# Altium project LUCID_LIGHT_PCB_Outer.PrjPcb
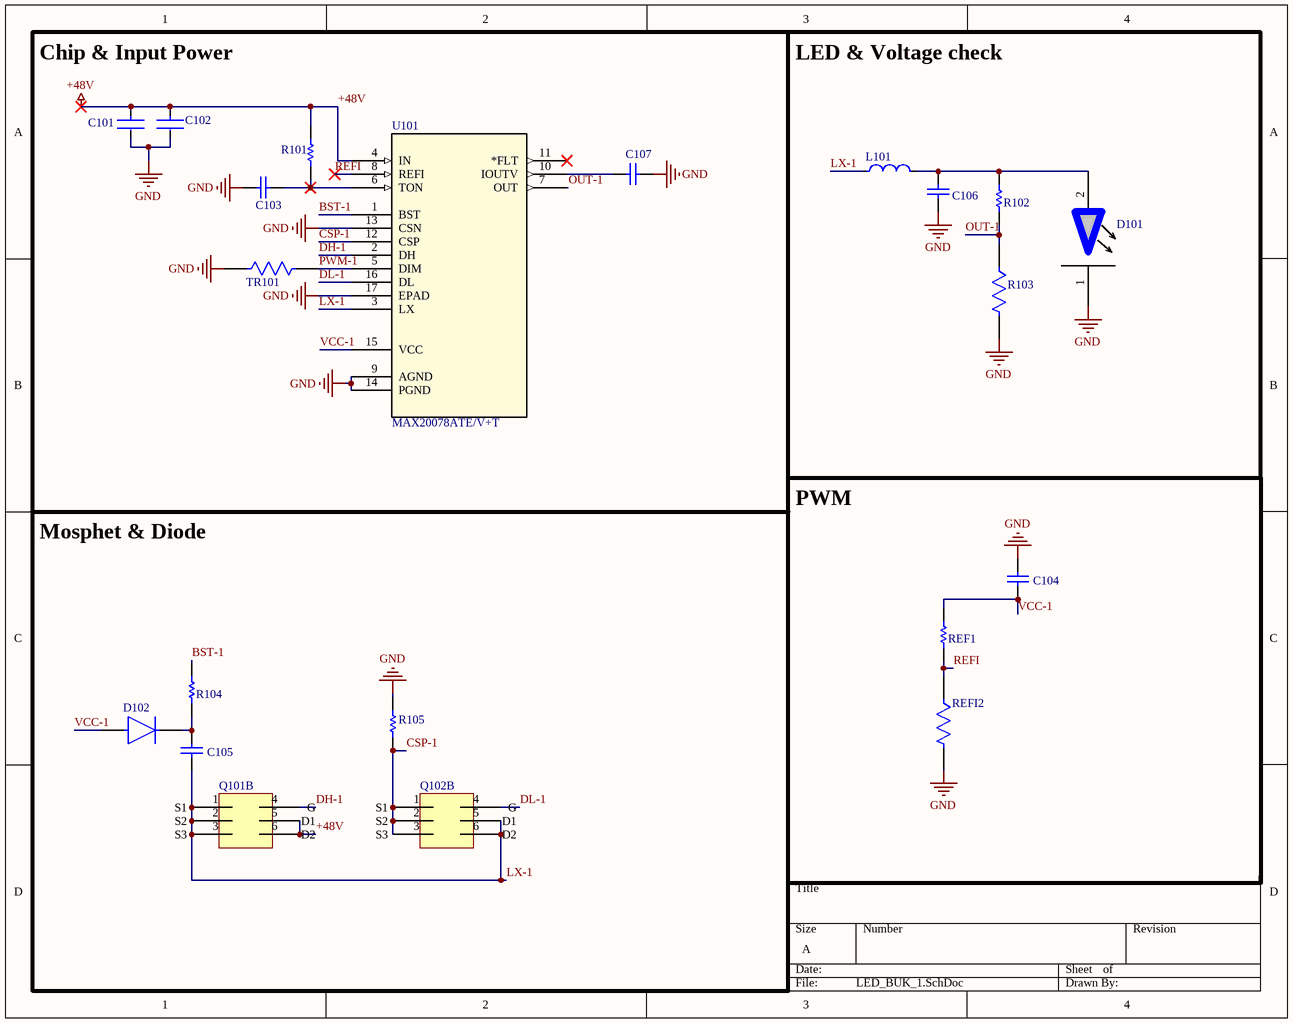
[diagram p0: LED_BUK_1.SchDoc]
7 sheets, 120 parts. Net scope: global (net labels, ports and power ports of the same name join across sheets).
Board file: LUCID_LIGHT_PCB_Outer.PcbDoc
Sheets:
  LED_BUK_1.SchDoc
  Power_Connector.SchDoc
  LED_BUK_2.SchDoc
  LED_BUK_3.SchDoc
  LED_BUK_4.SchDoc
  LED_BUK_5.SchDoc
  LED_BUK_6.SchDoc

## Sheet LED_BUK_1.SchDoc
size A; SheetNumber: 1; SheetTotal: 7

### Parts
C101  12101C225KAT2A  [FP-1210-L_3_3_0_4-W_2_5_0-IPC_B]  (value not drawn)
C102  12101C225KAT2A  [FP-1210-L_3_3_0_4-W_2_5_0-IPC_B]  (value not drawn)
C103  GRM1885C1H471JA01D  [C_0603_1608Metric]  (value not drawn)
C104  *AC0805KFX7R7BB225  [C_0805_2012Metric]  (value not drawn)
C105  CL10B224KA8NNNC  [C_0603_1608Metric]  (value not drawn)
C106  CL31B105KCHVPNE  [C_1210_3225Metric]  (value not drawn)
C107  CL31B105KCHVPNE  [C_1210_3225Metric]  (value not drawn)
D101  On back of PCB  [Bridgelux_V22_Custom]  (value not drawn)
D102  B180-13-F  [D_SMA_DO-214AC]  (value not drawn)
L101  YSPI1365-470M  [L_YSPI1365_470M]  (value not drawn)
Q101  custom mosfet  [LFPAK56_SOT669_BUK9Y107]  (value not drawn)  (part B of 2)
Q102  custom mosfet  [LFPAK56_SOT669_BUK9Y107]  (value not drawn)  (part B of 2)
R101  *RC0603FR-0747K5L  [R_0603_1608Metric]  (value not drawn)
R102  RC0603FR-07324KL  [RESC1608X55X25NL10T15]  (value not drawn)
R103  RC0603FR-0724K9L  [FP-RC_L0603-MFG]  (value not drawn)
R104  4R7 1% 0603(1608)  [RESC0603(1608)_M]  (value not drawn)
R105  FRM121WFR100TM  [R_1206_3216Metric]  (value not drawn)
REF1  ERJ-3EKF3162V  [RESC1608X55X30NL15T15]  (value not drawn)
REFI2  RC0603FR-0710KL  [FP-RC0603-0_55-IPC_C]  (value not drawn)
TR101  RC0603FR-0710KL  [FP-RC0603-0_55-IPC_C]  (value not drawn)
U101  MAX20078ATE/V+T  [21-0136V_T1633+4C_MXM]

### Nets
+48V: C101.1 C102.1 Q101.5(D1) Q101.6(D2) R101.1 U101.4(IN)
GND: C101.2 C102.2 C103.1 C104.1 C106.2 C107.2 D101.1 R103.2 R105.1 REFI2.2 TR101.1 U101.9(AGND) U101.13(CSN) U101.14(PGND) U101.17(EPAD)
BST-1: R104.2 U101.1(BST)
CSP-1: Q102.1(S1) Q102.2(S2) Q102.3(S3) R105.2 U101.12(CSP)
DH-1: Q101.4(G) U101.2(DH)
DL-1: Q102.4(G) U101.16(DL)
LX-1: C105.2 L101.1 Q101.1(S1) Q101.2(S2) Q101.3(S3) Q102.5(D1) Q102.6(D2) U101.3(LX)
OUT-1: R102.2 R103.1 U101.7(OUT)
PWM-1: TR101.2 U101.5(DIM)
REFI: REF1.2 REFI2.1 U101.8(REFI)
VCC-1: C104.2 D102.2(A) REF1.1 U101.15(VCC)
NetC103_2: C103.2 R101.2 U101.6(TON)
NetC105_1: C105.1 D102.1(C) R104.1
NetC106_1: C106.1 D101.2 L101.2 R102.1
NetC107_1: C107.1 U101.10(IOUTV)

Not connected (* = marked no-connect by the designer): U101 11(*FLT)*

### Notes on the sheet
- Chip & Input Power
- LED & Voltage check
- PWM
- Mosphet & Diode

### Library data of the parts
C101 C102 = CMP-1038-02104-3: General Purpose Ceramic Capacitor, 1210, 2.2uF, 10%, X7R, 15%, 100V; Dissipation Factor: 2.5%; Number of Pins: 2; Lead Free: Lead Free; Voltage Rating: 100V; Min Operating Temperature: -55°C; Height: 2.79mm; Length: 3.2mm; Capacitance: 2.2uF; RoHS Compliant: Yes; Case/Package: 1210; Max Operating Temperature: 125°C; Radiation Hardening: No; Series: -; Case Code (Metric): 3225; Dielectric: X7R; Voltage Rating (DC): 100V; Packaging: Tape and Reel; Width: 2.5mm; Thickness: 0.11inch; Depth: 2.5mm; Contact Plating: Tin; REACH SVHC: No SVHC; Tolerance: 10%; Construction: Flat; Case Code (Imperial): 1210; Mount: Surface Mount; Package Quantity: 1; Termination: SMD/SMT; Voltage: 100V; LCSC Part #: C2168116
C103 = GRM1885C1H471JA01D: 470 pF, 50 V, C0G, 0603; LCSC Part #: C85979; Supplier 1: Avnet; Supplier Part Number 1: GRM1885C1H471JA01D
C104 = AC0805KFX7R7BB225: 2.2 µF, 16 V, X7R, 0805; Supplier 1: Avnet; Supplier Part Number 1: AC0805KFX7R7BB225; LCSC Part #: C20143097
C105 = CL10B224KA8NNNC: 0.22 µF, 25 V, X7R, 0603; Supplier 1: Future Electronics; Supplier Part Number 1: CL10B224KA8NNNC; LCSC Part #: C21120
C106 C107 = CL31B105KCHVPNE: 1 µF, 100 V DC, 1206 (3216 metric); Supplier 1: Mouser; Supplier Part Number 1: 187-CL31B105KCHVPNE; LCSC Part #: C307368
D101 = Bridgelux_V22_Custom
D102 = B180-13-F: Schottky diode, SMA; Supplier 1: Newark; Supplier Part Number 1: B180-13-F; LCSC Part #: C155354
L101 = CompoYSPI1365-470Mnent_1: 47 µH inductor; LCSC Part #: C497913
Q101 Q102 = BUK9Y107-80EX: 80 V N-channel MOSFET; LSCS Part #: C503620; Supplier 1: Arrow Electronics; Supplier Part Number 1: BUK9Y107-80EX
R101 = RC0603FR-0747K5L: 47.5 kΩ; Supplier 1: Newark; Supplier Part Number 1: RC0603FR-0747K5L; LCSC Part #: C137715
R102 = CMP-2000-04009-1: Manufacturer: Yageo; Part Number: RC0603FR-07324KL; LCSC Part #: C273758
R103 = CMP-03412-013083-1: RES SMD 24.9K OHM 1% 1/10W 0603; Manufacturer: Yageo; Approved Alternate Part Number: 541-1.00HHCT-ND; Voltage Rating: 75V; Power Rating: 0.1W; Resistance: 24.9kΩ; Value: 24.9kΩ; Power: 100mW; Temperature Coefficient: 100ppm/°C; Footprint Url: https://www.yageo.com/upload/website/yageo_PYu-R_Mount_10_19050818_343.pdf; Automotive: No; Temperature Range Low: -55°C; Manufacturer Part Number: RC0603FR-0724K9L; Ipc Land Pattern Name: RESC16080X45; Digikey Description: RES SMD 24.9K OHM 1% 1/10W 0603; Voltage: 75V; Composition: Thick Film; Device Class L1: Passive Components; Device Class L2: Resistors; Device Class L3: Chip SMD Resistors; ComponentLink2URL: https://www.yageo.com/upload/media/product/productsearch/datasheet/rchip/PYu-RC_Group_51_RoHS_L_10.pdf; Series: RC_L; Octopart: https://octopart.com/rc0603fr-0724k9l-yageo-1189838; RoHS: TRUE; Category: Res; Height: 0.55mm; Tolerance: 1%; Temperature: -55°C to +155°C; Temperature Range High: +155°C; ComponentLink2Description: Datasheet; Package: RC_L0603; Lead Free: Yes; Mouser Description: Res Thick Film 1.6 x 0.8 mm 24.9K Ohm 1% 0.1W(1/10W) 100ppm/ C Molded SMD Paper T/R; LCSC Part #: C137761
R104 = CMP-1012-00247-1: 4R7 0.1W 1% 0603 (1608 Metric)  SMD; Case-EIA: 0603; Case-Metric: 1608; Value: 4.70 Ohm; Power: 0.1 W; Technology: SMT; Tolerance: 1 %; LCSC Part #: C137705
R105 = FRM121WFR100TM: 0.1 Ω, 1 W, 1206; LCSC Part #: C7467250
REF1 = CMP-2000-00428-1: Manufacturer: Panasonic; Part Number: ERJ-3EKF3162V; LCSC Part #: C403154
REFI2 TR101 = CMP-2100-03664-2: RES 10K OHM 1% 1/10W 0603; Voltage Rating: 75V; Voltage Rating (DC): 50V; Resistance: 10kR; Power Rating: 100mW; Temperature Coefficient: 100ppm/°C; Depth: 0.8mm; Termination: SMD/SMT; Resistor Type: Thick Film; Series: RC; Construction: Rectangular; Features: Moisture Resistant; Packaging: Tape and Reel; Min Operating Temperature: -55°C; Number of Terminations: 2; Lead Pitch: 0.3mm; RoHS Compliant: Yes; Case/Package: 0603; Resistance Tolerance: 1%; Military Standard: Not; Weight: 7.1E-05oz; Number of Pins: 2; Tolerance: 1%; Length: 1.6mm; Case Code (Imperial): 0603; Lead Free: Lead Free; Width: 0.8mm; Max Power Dissipation: 100mW; Height: 0.45mm; Max Operating Temperature: 155°C; Case Code (Metric): 1608; Size Code: 0603; LCSC Part #: C98220
U101 = MAX20078ATEV+T: Synchronous Buck, High-Brightness LED Controller; Manufacturer_Name: Analog Devices Inc; LSCS Part #: C2679249; Copyright: Copyright (C) 2026 Ultra Librarian. All rights reserved.; Manufacturer_Part_Number: MAX20078ATE/V+T; RefDes: RefDes; Type: Type; Supplier 1: Mouser; Supplier Part Number 1: 700-MAX20078ATE/V+T

## Sheet Power_Connector.SchDoc
size A; SheetNumber: 2; SheetTotal: 7
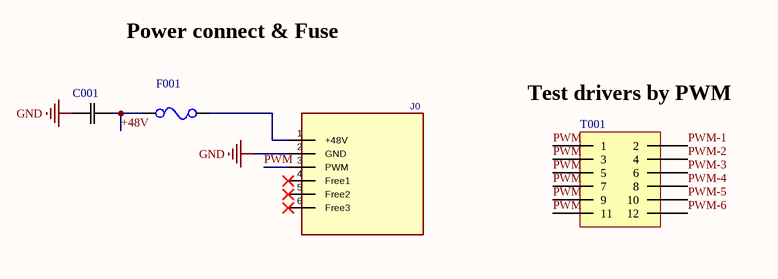
[diagram p1: Power_Connector.SchDoc]

### Parts
C001  MAL214658471E3  [CAP_2135_18X20_VIS]  (value not drawn)
F001  JFC2410-2200FS  [F_2410_JDTfuse]  (value not drawn)
J0  AS150UPB_2+4  [AS150UPB_2+4]  (value not drawn)
T001  DS1021-2x6SF11-B  [LUCID_Connectors]  (value not drawn)

### Nets
+48V: C001.1 F001.2
GND: C001.2 J0.2(GND)
PWM: J0.3(PWM) T001.1 T001.3 T001.5 T001.7 T001.9 T001.11
PWM-1: T001.2
PWM-2: T001.4
PWM-3: T001.6
PWM-4: T001.8
PWM-5: T001.10
PWM-6: T001.12
NetF001_1: F001.1 J0.1(+48V)

Not connected (* = marked no-connect by the designer): J0 4(Free1)* 5(Free2)* 6(Free3)*

### Notes on the sheet
- Power connect & Fuse
- (near T001) Test drivers by PWM

### Library data of the parts
C001 = MAL214658471E3: Rad 63V 470uF 18x20 125Â°C (CA); Manufacturer_Name: Vishay; Copyright: Copyright (C) 2026 Ultra Librarian. All rights reserved.; Manufacturer_Part_Number: MAL214658471E3; JLCPCB Part #: C85979
F001 = JFC2410-2200FS: 20A Fuse. 72V; LSCS Part #: JDTfuse
T001 = DS1021-2x6SF11-B: For testing. Dims PWM; LCSC Part #: C7430402

## Sheet LED_BUK_2.SchDoc
size A; SheetNumber: 3; SheetTotal: 7
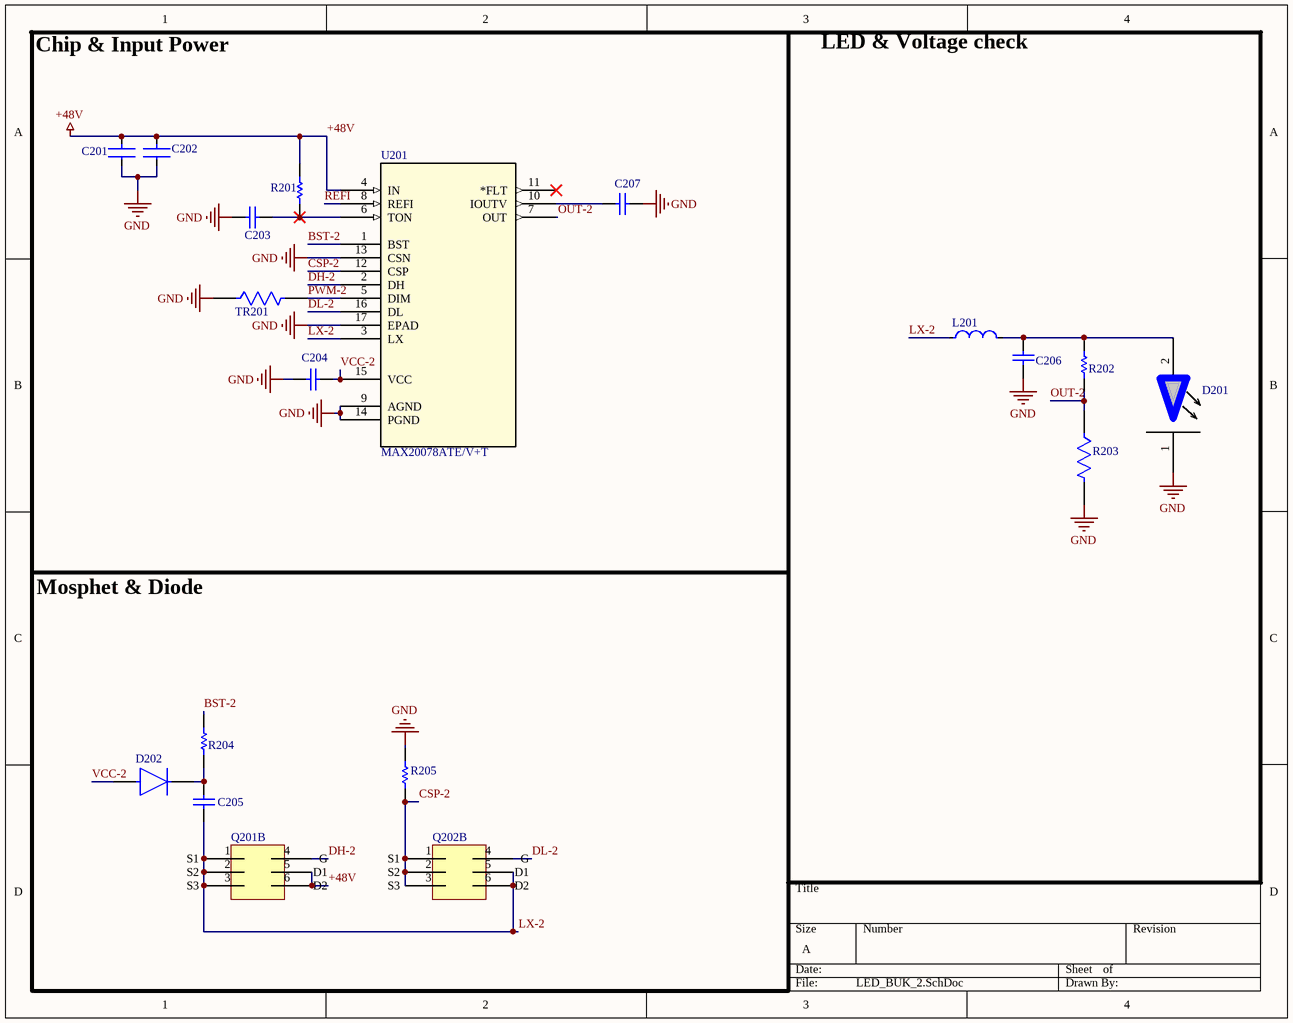
[diagram p2: LED_BUK_2.SchDoc]

### Parts
C201  12101C225KAT2A  [FP-1210-L_3_3_0_4-W_2_5_0-IPC_B]  (value not drawn)
C202  12101C225KAT2A  [FP-1210-L_3_3_0_4-W_2_5_0-IPC_B]  (value not drawn)
C203  GRM1885C1H471JA01D  [C_0603_1608Metric]  (value not drawn)
C204  *AC0805KFX7R7BB225  [C_0805_2012Metric]  (value not drawn)
C205  CL10B224KA8NNNC  [C_0603_1608Metric]  (value not drawn)
C206  CL31B105KCHVPNE  [C_1210_3225Metric]  (value not drawn)
C207  CL31B105KCHVPNE  [C_1210_3225Metric]  (value not drawn)
D201  On back of PCB  [Bridgelux_V22_Custom]  (value not drawn)
D202  B180-13-F  [D_SMA_DO-214AC]  (value not drawn)
L201  YSPI1365-470M  [L_YSPI1365_470M]  (value not drawn)
Q201  custom mosfet  [LFPAK56_SOT669_BUK9Y107]  (value not drawn)  (part B of 2)
Q202  custom mosfet  [LFPAK56_SOT669_BUK9Y107]  (value not drawn)  (part B of 2)
R201  *RC0603FR-0747K5L  [R_0603_1608Metric]  (value not drawn)
R202  RC0603FR-07324KL  [RESC1608X55X25NL10T15]  (value not drawn)
R203  RC0603FR-0724K9L  [FP-RC_L0603-MFG]  (value not drawn)
R204  4R7 1% 0603(1608)  [RESC0603(1608)_M]  (value not drawn)
R205  FRM121WFR100TM  [R_1206_3216Metric]  (value not drawn)
TR201  RC0603FR-0710KL  [FP-RC0603-0_55-IPC_C]  (value not drawn)
U201  MAX20078ATE/V+T  [21-0136V_T1633+4C_MXM]

### Nets
+48V: C201.1 C202.1 Q201.5(D1) Q201.6(D2) R201.1 U201.4(IN)
GND: C201.2 C202.2 C203.1 C204.2 C206.2 C207.2 D201.1 R203.2 R205.1 TR201.1 U201.9(AGND) U201.13(CSN) U201.14(PGND) U201.17(EPAD)
BST-2: R204.2 U201.1(BST)
CSP-2: Q202.1(S1) Q202.2(S2) Q202.3(S3) R205.2 U201.12(CSP)
DH-2: Q201.4(G) U201.2(DH)
DL-2: Q202.4(G) U201.16(DL)
LX-2: C205.2 L201.1 Q201.1(S1) Q201.2(S2) Q201.3(S3) Q202.5(D1) Q202.6(D2) U201.3(LX)
OUT-2: R202.2 R203.1 U201.7(OUT)
PWM-2: TR201.2 U201.5(DIM)
REFI: U201.8(REFI)
VCC-2: C204.1 D202.2(A) U201.15(VCC)
NetC203_2: C203.2 R201.2 U201.6(TON)
NetC205_1: C205.1 D202.1(C) R204.1
NetC206_1: C206.1 D201.2 L201.2 R202.1
NetC207_1: C207.1 U201.10(IOUTV)

Not connected (* = marked no-connect by the designer): U201 11(*FLT)*

### Notes on the sheet
- Chip & Input Power
- LED & Voltage check
- Mosphet & Diode

### Library data of the parts
C201 C202 = CMP-1038-02104-3: as C101 on sheet LED_BUK_1; Number of Pins: 2; Lead Free: Lead Free; Voltage Rating: 100V; Min Operating Temperature: -55°C; Height: 2.79mm; Length: 3.2mm; Capacitance: 2.2uF; RoHS Compliant: Yes; Case/Package: 1210; Max Operating Temperature: 125°C; Radiation Hardening: No; Series: -; Case Code (Metric): 3225; Dielectric: X7R; Voltage Rating (DC): 100V; Packaging: Tape and Reel; Width: 2.5mm; Thickness: 0.11inch; Depth: 2.5mm; Contact Plating: Tin; REACH SVHC: No SVHC; Tolerance: 10%; Construction: Flat; Case Code (Imperial): 1210; Mount: Surface Mount; Package Quantity: 1; Termination: SMD/SMT; Voltage: 100V; LCSC Part #: C2168116
C203 = GRM1885C1H471JA01D: 470 pF, 50 V, C0G, 0603; LCSC Part #: C85979; Supplier 1: Avnet; Supplier Part Number 1: GRM1885C1H471JA01D
C204 = AC0805KFX7R7BB225: 2.2 µF, 16 V, X7R, 0805; Supplier 1: Avnet; Supplier Part Number 1: AC0805KFX7R7BB225; LCSC Part #: C20143097
C205 = CL10B224KA8NNNC: 0.22 µF, 25 V, X7R, 0603; Supplier 1: Future Electronics; Supplier Part Number 1: CL10B224KA8NNNC; LCSC Part #: C21120
C206 C207 = CL31B105KCHVPNE: 1 µF, 100 V DC, 1206 (3216 metric); Supplier 1: Mouser; Supplier Part Number 1: 187-CL31B105KCHVPNE; LCSC Part #: C307368
D201 = Bridgelux_V22_Custom
D202 = B180-13-F: Schottky diode, SMA; Supplier 1: Newark; Supplier Part Number 1: B180-13-F; LCSC Part #: C155354
L201 = CompoYSPI1365-470Mnent_1: 47 µH inductor; LCSC Part #: C497913
Q201 Q202 = BUK9Y107-80EX: as Q101 on sheet LED_BUK_1; Supplier 1: Arrow Electronics; Supplier Part Number 1: BUK9Y107-80EX
R201 = RC0603FR-0747K5L: 47.5 kΩ; Supplier 1: Newark; Supplier Part Number 1: RC0603FR-0747K5L; LCSC Part #: C137715
R202 = CMP-2000-04009-1: Manufacturer: Yageo; Part Number: RC0603FR-07324KL; LCSC Part #: C273758
R203 = CMP-03412-013083-1: as R103 on sheet LED_BUK_1; Footprint Url: https://www.yageo.com/upload/website/yageo_PYu-R_Mount_10_19050818_343.pdf; Automotive: No; Temperature Range Low: -55°C; Manufacturer Part Number: RC0603FR-0724K9L; Ipc Land Pattern Name: RESC16080X45; Digikey Description: RES SMD 24.9K OHM 1% 1/10W 0603; Voltage: 75V; Composition: Thick Film; Device Class L1: Passive Components; Device Class L2: Resistors; Device Class L3: Chip SMD Resistors; ComponentLink2URL: https://www.yageo.com/upload/media/product/productsearch/datasheet/rchip/PYu-RC_Group_51_RoHS_L_10.pdf; Series: RC_L; Octopart: https://octopart.com/rc0603fr-0724k9l-yageo-1189838; RoHS: TRUE; Category: Res; Height: 0.55mm; Tolerance: 1%; Temperature: -55°C to +155°C; Temperature Range High: +155°C; ComponentLink2Description: Datasheet; Package: RC_L0603; Lead Free: Yes; Mouser Description: Res Thick Film 1.6 x 0.8 mm 24.9K Ohm 1% 0.1W(1/10W) 100ppm/ C Molded SMD Paper T/R; LCSC Part #: C137761
R204 = CMP-1012-00247-1: as R104 on sheet LED_BUK_1; Power: 0.1 W; Technology: SMT; Tolerance: 1 %; LCSC Part #: C137705
R205 = FRM121WFR100TM: 0.1 Ω, 1 W, 1206; LCSC Part #: C7467250
TR201 = CMP-2100-03664-2: as REFI2 on sheet LED_BUK_1; Depth: 0.8mm; Termination: SMD/SMT; Resistor Type: Thick Film; Series: RC; Construction: Rectangular; Features: Moisture Resistant; Packaging: Tape and Reel; Min Operating Temperature: -55°C; Number of Terminations: 2; Lead Pitch: 0.3mm; RoHS Compliant: Yes; Case/Package: 0603; Resistance Tolerance: 1%; Military Standard: Not; Weight: 7.1E-05oz; Number of Pins: 2; Tolerance: 1%; Length: 1.6mm; Case Code (Imperial): 0603; Lead Free: Lead Free; Width: 0.8mm; Max Power Dissipation: 100mW; Height: 0.45mm; Max Operating Temperature: 155°C; Case Code (Metric): 1608; Size Code: 0603; LCSC Part #: C98220
U201 = MAX20078ATEV+T: as U101 on sheet LED_BUK_1; Copyright: Copyright (C) 2026 Ultra Librarian. All rights reserved.; Manufacturer_Part_Number: MAX20078ATE/V+T; RefDes: RefDes; Type: Type; Supplier 1: Mouser; Supplier Part Number 1: 700-MAX20078ATE/V+T

## Sheet LED_BUK_3.SchDoc
size A; SheetNumber: 4; SheetTotal: 7
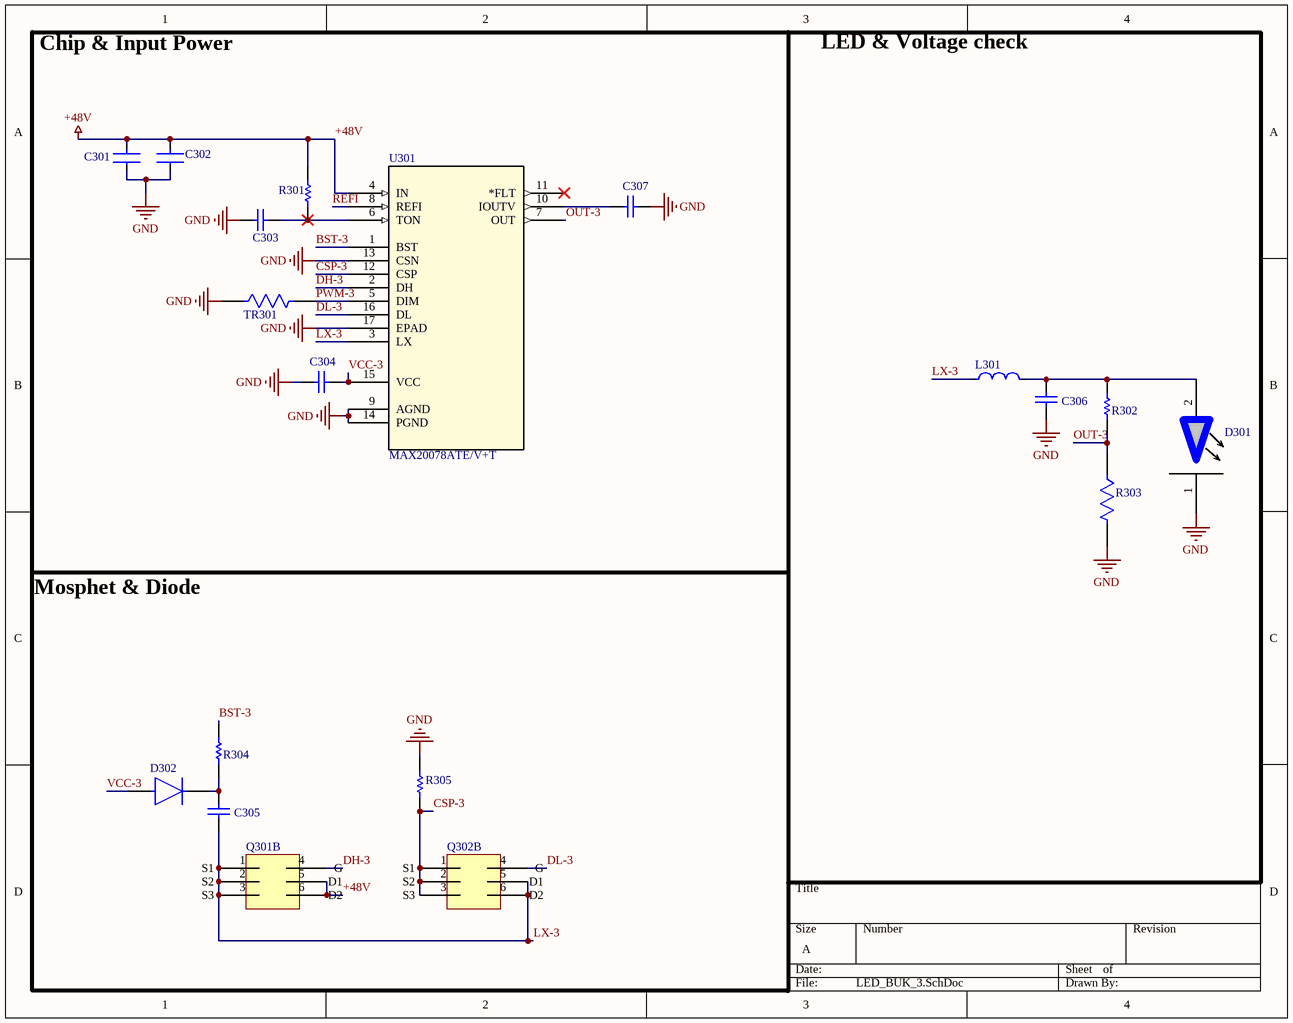
[diagram p3: LED_BUK_3.SchDoc]

### Parts
C301  12101C225KAT2A  [FP-1210-L_3_3_0_4-W_2_5_0-IPC_B]  (value not drawn)
C302  12101C225KAT2A  [FP-1210-L_3_3_0_4-W_2_5_0-IPC_B]  (value not drawn)
C303  GRM1885C1H471JA01D  [C_0603_1608Metric]  (value not drawn)
C304  *AC0805KFX7R7BB225  [C_0805_2012Metric]  (value not drawn)
C305  CL10B224KA8NNNC  [C_0603_1608Metric]  (value not drawn)
C306  CL31B105KCHVPNE  [C_1210_3225Metric]  (value not drawn)
C307  CL31B105KCHVPNE  [C_1210_3225Metric]  (value not drawn)
D301  On back of PCB  [Bridgelux_V22_Custom]  (value not drawn)
D302  B180-13-F  [D_SMA_DO-214AC]  (value not drawn)
L301  YSPI1365-470M  [L_YSPI1365_470M]  (value not drawn)
Q301  custom mosfet  [LFPAK56_SOT669_BUK9Y107]  (value not drawn)  (part B of 2)
Q302  custom mosfet  [LFPAK56_SOT669_BUK9Y107]  (value not drawn)  (part B of 2)
R301  *RC0603FR-0747K5L  [R_0603_1608Metric]  (value not drawn)
R302  RC0603FR-07324KL  [RESC1608X55X25NL10T15]  (value not drawn)
R303  RC0603FR-0724K9L  [FP-RC_L0603-MFG]  (value not drawn)
R304  4R7 1% 0603(1608)  [RESC0603(1608)_M]  (value not drawn)
R305  FRM121WFR100TM  [R_1206_3216Metric]  (value not drawn)
TR301  RC0603FR-0710KL  [FP-RC0603-0_55-IPC_C]  (value not drawn)
U301  MAX20078ATE/V+T  [21-0136V_T1633+4C_MXM]

### Nets
+48V: C301.1 C302.1 Q301.5(D1) Q301.6(D2) R301.1 U301.4(IN)
GND: C301.2 C302.2 C303.1 C304.2 C306.2 C307.2 D301.1 R303.2 R305.1 TR301.1 U301.9(AGND) U301.13(CSN) U301.14(PGND) U301.17(EPAD)
BST-3: R304.2 U301.1(BST)
CSP-3: Q302.1(S1) Q302.2(S2) Q302.3(S3) R305.2 U301.12(CSP)
DH-3: Q301.4(G) U301.2(DH)
DL-3: Q302.4(G) U301.16(DL)
LX-3: C305.2 L301.1 Q301.1(S1) Q301.2(S2) Q301.3(S3) Q302.5(D1) Q302.6(D2) U301.3(LX)
OUT-3: R302.2 R303.1 U301.7(OUT)
PWM-3: TR301.2 U301.5(DIM)
REFI: U301.8(REFI)
VCC-3: C304.1 D302.2(A) U301.15(VCC)
NetC303_2: C303.2 R301.2 U301.6(TON)
NetC305_1: C305.1 D302.1(C) R304.1
NetC306_1: C306.1 D301.2 L301.2 R302.1
NetC307_1: C307.1 U301.10(IOUTV)

Not connected (* = marked no-connect by the designer): U301 11(*FLT)*

### Notes on the sheet
- Chip & Input Power
- LED & Voltage check
- Mosphet & Diode

### Library data of the parts
C301 C302 = CMP-1038-02104-3: as C101 on sheet LED_BUK_1; Number of Pins: 2; Lead Free: Lead Free; Voltage Rating: 100V; Min Operating Temperature: -55°C; Height: 2.79mm; Length: 3.2mm; Capacitance: 2.2uF; RoHS Compliant: Yes; Case/Package: 1210; Max Operating Temperature: 125°C; Radiation Hardening: No; Series: -; Case Code (Metric): 3225; Dielectric: X7R; Voltage Rating (DC): 100V; Packaging: Tape and Reel; Width: 2.5mm; Thickness: 0.11inch; Depth: 2.5mm; Contact Plating: Tin; REACH SVHC: No SVHC; Tolerance: 10%; Construction: Flat; Case Code (Imperial): 1210; Mount: Surface Mount; Package Quantity: 1; Termination: SMD/SMT; Voltage: 100V; LCSC Part #: C2168116
C303 = GRM1885C1H471JA01D: 470 pF, 50 V, C0G, 0603; LCSC Part #: C85979; Supplier 1: Avnet; Supplier Part Number 1: GRM1885C1H471JA01D
C304 = AC0805KFX7R7BB225: 2.2 µF, 16 V, X7R, 0805; Supplier 1: Avnet; Supplier Part Number 1: AC0805KFX7R7BB225; LCSC Part #: C20143097
C305 = CL10B224KA8NNNC: 0.22 µF, 25 V, X7R, 0603; Supplier 1: Future Electronics; Supplier Part Number 1: CL10B224KA8NNNC; LCSC Part #: C21120
C306 C307 = CL31B105KCHVPNE: 1 µF, 100 V DC, 1206 (3216 metric); Supplier 1: Mouser; Supplier Part Number 1: 187-CL31B105KCHVPNE; LCSC Part #: C307368
D301 = Bridgelux_V22_Custom
D302 = B180-13-F: Schottky diode, SMA; Supplier 1: Newark; Supplier Part Number 1: B180-13-F; LCSC Part #: C155354
L301 = CompoYSPI1365-470Mnent_1: 47 µH inductor; LCSC Part #: C497913
Q301 Q302 = BUK9Y107-80EX: as Q101 on sheet LED_BUK_1; Supplier 1: Arrow Electronics; Supplier Part Number 1: BUK9Y107-80EX
R301 = RC0603FR-0747K5L: 47.5 kΩ; Supplier 1: Newark; Supplier Part Number 1: RC0603FR-0747K5L; LCSC Part #: C137715
R302 = CMP-2000-04009-1: Manufacturer: Yageo; Part Number: RC0603FR-07324KL; LCSC Part #: C273758
R303 = CMP-03412-013083-1: as R103 on sheet LED_BUK_1; Footprint Url: https://www.yageo.com/upload/website/yageo_PYu-R_Mount_10_19050818_343.pdf; Automotive: No; Temperature Range Low: -55°C; Manufacturer Part Number: RC0603FR-0724K9L; Ipc Land Pattern Name: RESC16080X45; Digikey Description: RES SMD 24.9K OHM 1% 1/10W 0603; Voltage: 75V; Composition: Thick Film; Device Class L1: Passive Components; Device Class L2: Resistors; Device Class L3: Chip SMD Resistors; ComponentLink2URL: https://www.yageo.com/upload/media/product/productsearch/datasheet/rchip/PYu-RC_Group_51_RoHS_L_10.pdf; Series: RC_L; Octopart: https://octopart.com/rc0603fr-0724k9l-yageo-1189838; RoHS: TRUE; Category: Res; Height: 0.55mm; Tolerance: 1%; Temperature: -55°C to +155°C; Temperature Range High: +155°C; ComponentLink2Description: Datasheet; Package: RC_L0603; Lead Free: Yes; Mouser Description: Res Thick Film 1.6 x 0.8 mm 24.9K Ohm 1% 0.1W(1/10W) 100ppm/ C Molded SMD Paper T/R; LCSC Part #: C137761
R304 = CMP-1012-00247-1: as R104 on sheet LED_BUK_1; Power: 0.1 W; Technology: SMT; Tolerance: 1 %; LCSC Part #: C137705
R305 = FRM121WFR100TM: 0.1 Ω, 1 W, 1206; LCSC Part #: C7467250
TR301 = CMP-2100-03664-2: as REFI2 on sheet LED_BUK_1; Depth: 0.8mm; Termination: SMD/SMT; Resistor Type: Thick Film; Series: RC; Construction: Rectangular; Features: Moisture Resistant; Packaging: Tape and Reel; Min Operating Temperature: -55°C; Number of Terminations: 2; Lead Pitch: 0.3mm; RoHS Compliant: Yes; Case/Package: 0603; Resistance Tolerance: 1%; Military Standard: Not; Weight: 7.1E-05oz; Number of Pins: 2; Tolerance: 1%; Length: 1.6mm; Case Code (Imperial): 0603; Lead Free: Lead Free; Width: 0.8mm; Max Power Dissipation: 100mW; Height: 0.45mm; Max Operating Temperature: 155°C; Case Code (Metric): 1608; Size Code: 0603; LCSC Part #: C98220
U301 = MAX20078ATEV+T: as U101 on sheet LED_BUK_1; Copyright: Copyright (C) 2026 Ultra Librarian. All rights reserved.; Manufacturer_Part_Number: MAX20078ATE/V+T; RefDes: RefDes; Type: Type; Supplier 1: Mouser; Supplier Part Number 1: 700-MAX20078ATE/V+T

## Sheet LED_BUK_4.SchDoc
size A; SheetNumber: 5; SheetTotal: 7
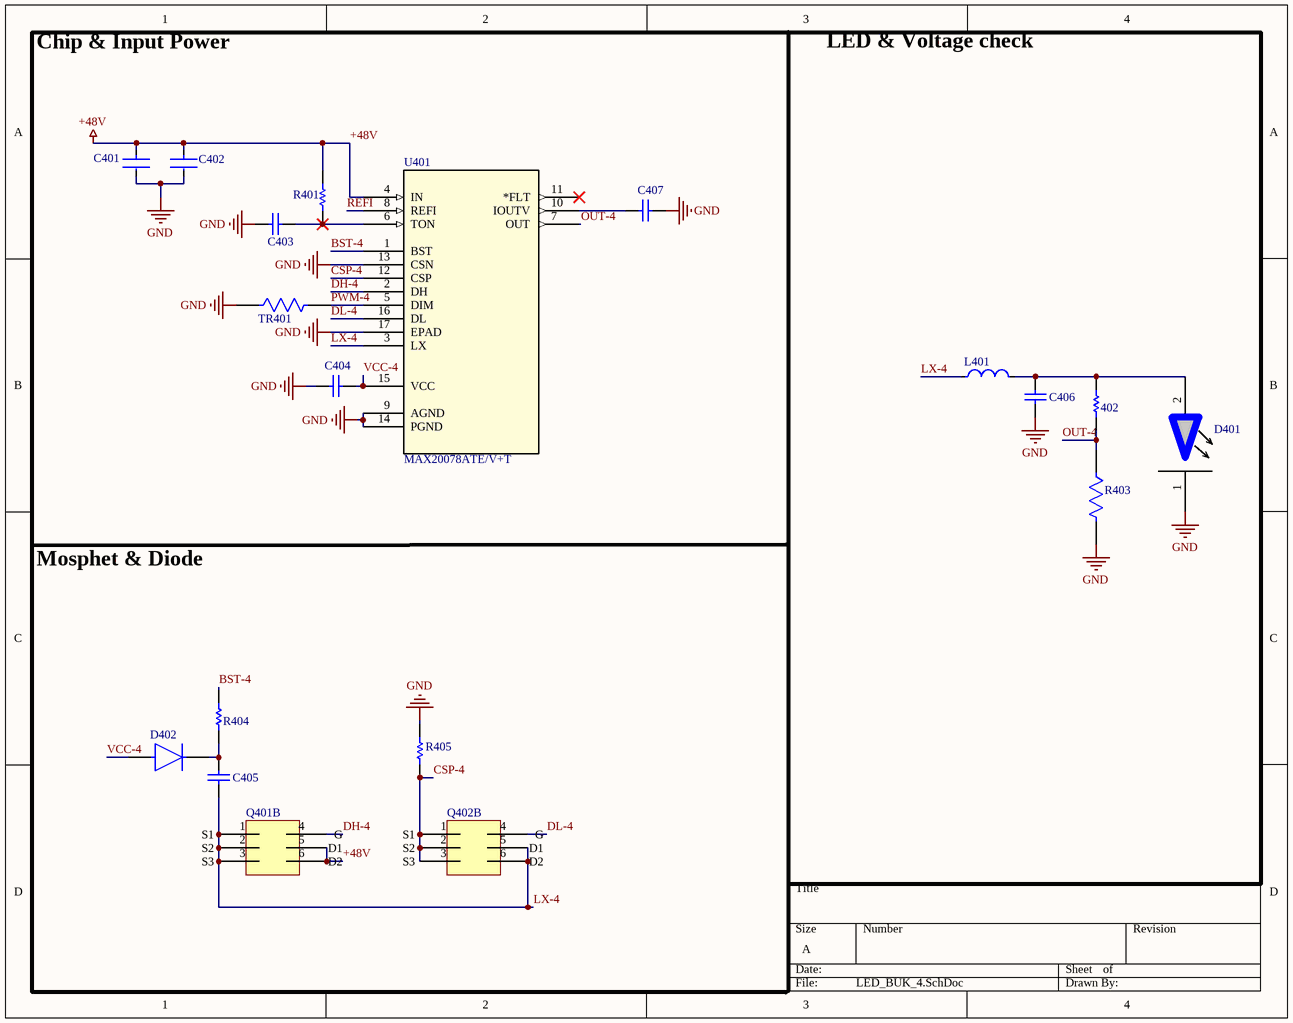
[diagram p4: LED_BUK_4.SchDoc]

### Parts
402  RC0603FR-07324KL  [RESC1608X55X25NL10T15]  (value not drawn)
C401  12101C225KAT2A  [FP-1210-L_3_3_0_4-W_2_5_0-IPC_B]  (value not drawn)
C402  12101C225KAT2A  [FP-1210-L_3_3_0_4-W_2_5_0-IPC_B]  (value not drawn)
C403  GRM1885C1H471JA01D  [C_0603_1608Metric]  (value not drawn)
C404  *AC0805KFX7R7BB225  [C_0805_2012Metric]  (value not drawn)
C405  CL10B224KA8NNNC  [C_0603_1608Metric]  (value not drawn)
C406  CL31B105KCHVPNE  [C_1210_3225Metric]  (value not drawn)
C407  CL31B105KCHVPNE  [C_1210_3225Metric]  (value not drawn)
D401  On back of PCB  [Bridgelux_V22_Custom]  (value not drawn)
D402  B180-13-F  [D_SMA_DO-214AC]  (value not drawn)
L401  YSPI1365-470M  [L_YSPI1365_470M]  (value not drawn)
Q401  custom mosfet  [LFPAK56_SOT669_BUK9Y107]  (value not drawn)  (part B of 2)
Q402  custom mosfet  [LFPAK56_SOT669_BUK9Y107]  (value not drawn)  (part B of 2)
R401  *RC0603FR-0747K5L  [R_0603_1608Metric]  (value not drawn)
R403  RC0603FR-0724K9L  [FP-RC_L0603-MFG]  (value not drawn)
R404  4R7 1% 0603(1608)  [RESC0603(1608)_M]  (value not drawn)
R405  FRM121WFR100TM  [R_1206_3216Metric]  (value not drawn)
TR401  RC0603FR-0710KL  [FP-RC0603-0_55-IPC_C]  (value not drawn)
U401  MAX20078ATE/V+T  [21-0136V_T1633+4C_MXM]

### Nets
+48V: C401.1 C402.1 Q401.5(D1) Q401.6(D2) R401.1 U401.4(IN)
GND: C401.2 C402.2 C403.1 C404.2 C406.2 C407.2 D401.1 R403.2 R405.1 TR401.1 U401.9(AGND) U401.13(CSN) U401.14(PGND) U401.17(EPAD)
BST-4: R404.2 U401.1(BST)
CSP-4: Q402.1(S1) Q402.2(S2) Q402.3(S3) R405.2 U401.12(CSP)
DH-4: Q401.4(G) U401.2(DH)
DL-4: Q402.4(G) U401.16(DL)
LX-4: C405.2 L401.1 Q401.1(S1) Q401.2(S2) Q401.3(S3) Q402.5(D1) Q402.6(D2) U401.3(LX)
OUT-4: 402.2 R403.1 U401.7(OUT)
PWM-4: TR401.2 U401.5(DIM)
REFI: U401.8(REFI)
VCC-4: C404.1 D402.2(A) U401.15(VCC)
Net402_1: 402.1 C406.1 D401.2 L401.2
NetC403_2: C403.2 R401.2 U401.6(TON)
NetC405_1: C405.1 D402.1(C) R404.1
NetC407_1: C407.1 U401.10(IOUTV)

Not connected (* = marked no-connect by the designer): U401 11(*FLT)*

### Notes on the sheet
- Chip & Input Power
- LED & Voltage check
- Mosphet & Diode

### Library data of the parts
402 = CMP-2000-04009-1: Manufacturer: Yageo; Part Number: RC0603FR-07324KL; LCSC Part #: C273758
C401 C402 = CMP-1038-02104-3: as C101 on sheet LED_BUK_1; Number of Pins: 2; Lead Free: Lead Free; Voltage Rating: 100V; Min Operating Temperature: -55°C; Height: 2.79mm; Length: 3.2mm; Capacitance: 2.2uF; RoHS Compliant: Yes; Case/Package: 1210; Max Operating Temperature: 125°C; Radiation Hardening: No; Series: -; Case Code (Metric): 3225; Dielectric: X7R; Voltage Rating (DC): 100V; Packaging: Tape and Reel; Width: 2.5mm; Thickness: 0.11inch; Depth: 2.5mm; Contact Plating: Tin; REACH SVHC: No SVHC; Tolerance: 10%; Construction: Flat; Case Code (Imperial): 1210; Mount: Surface Mount; Package Quantity: 1; Termination: SMD/SMT; Voltage: 100V; LCSC Part #: C2168116
C403 = GRM1885C1H471JA01D: 470 pF, 50 V, C0G, 0603; LCSC Part #: C85979; Supplier 1: Avnet; Supplier Part Number 1: GRM1885C1H471JA01D
C404 = AC0805KFX7R7BB225: 2.2 µF, 16 V, X7R, 0805; Supplier 1: Avnet; Supplier Part Number 1: AC0805KFX7R7BB225; LCSC Part #: C20143097
C405 = CL10B224KA8NNNC: 0.22 µF, 25 V, X7R, 0603; Supplier 1: Future Electronics; Supplier Part Number 1: CL10B224KA8NNNC; LCSC Part #: C21120
C406 C407 = CL31B105KCHVPNE: 1 µF, 100 V DC, 1206 (3216 metric); Supplier 1: Mouser; Supplier Part Number 1: 187-CL31B105KCHVPNE; LCSC Part #: C307368
D401 = Bridgelux_V22_Custom
D402 = B180-13-F: Schottky diode, SMA; Supplier 1: Newark; Supplier Part Number 1: B180-13-F; LCSC Part #: C155354
L401 = CompoYSPI1365-470Mnent_1: 47 µH inductor; LCSC Part #: C497913
Q401 Q402 = BUK9Y107-80EX: as Q101 on sheet LED_BUK_1; Supplier 1: Arrow Electronics; Supplier Part Number 1: BUK9Y107-80EX
R401 = RC0603FR-0747K5L: 47.5 kΩ; Supplier 1: Newark; Supplier Part Number 1: RC0603FR-0747K5L; LCSC Part #: C137715
R403 = CMP-03412-013083-1: as R103 on sheet LED_BUK_1; Footprint Url: https://www.yageo.com/upload/website/yageo_PYu-R_Mount_10_19050818_343.pdf; Automotive: No; Temperature Range Low: -55°C; Manufacturer Part Number: RC0603FR-0724K9L; Ipc Land Pattern Name: RESC16080X45; Digikey Description: RES SMD 24.9K OHM 1% 1/10W 0603; Voltage: 75V; Composition: Thick Film; Device Class L1: Passive Components; Device Class L2: Resistors; Device Class L3: Chip SMD Resistors; ComponentLink2URL: https://www.yageo.com/upload/media/product/productsearch/datasheet/rchip/PYu-RC_Group_51_RoHS_L_10.pdf; Series: RC_L; Octopart: https://octopart.com/rc0603fr-0724k9l-yageo-1189838; RoHS: TRUE; Category: Res; Height: 0.55mm; Tolerance: 1%; Temperature: -55°C to +155°C; Temperature Range High: +155°C; ComponentLink2Description: Datasheet; Package: RC_L0603; Lead Free: Yes; Mouser Description: Res Thick Film 1.6 x 0.8 mm 24.9K Ohm 1% 0.1W(1/10W) 100ppm/ C Molded SMD Paper T/R; LCSC Part #: C137761
R404 = CMP-1012-00247-1: as R104 on sheet LED_BUK_1; Power: 0.1 W; Technology: SMT; Tolerance: 1 %; LCSC Part #: C137705
R405 = FRM121WFR100TM: 0.1 Ω, 1 W, 1206; LCSC Part #: C7467250
TR401 = CMP-2100-03664-2: as REFI2 on sheet LED_BUK_1; Depth: 0.8mm; Termination: SMD/SMT; Resistor Type: Thick Film; Series: RC; Construction: Rectangular; Features: Moisture Resistant; Packaging: Tape and Reel; Min Operating Temperature: -55°C; Number of Terminations: 2; Lead Pitch: 0.3mm; RoHS Compliant: Yes; Case/Package: 0603; Resistance Tolerance: 1%; Military Standard: Not; Weight: 7.1E-05oz; Number of Pins: 2; Tolerance: 1%; Length: 1.6mm; Case Code (Imperial): 0603; Lead Free: Lead Free; Width: 0.8mm; Max Power Dissipation: 100mW; Height: 0.45mm; Max Operating Temperature: 155°C; Case Code (Metric): 1608; Size Code: 0603; LCSC Part #: C98220
U401 = MAX20078ATEV+T: as U101 on sheet LED_BUK_1; Copyright: Copyright (C) 2026 Ultra Librarian. All rights reserved.; Manufacturer_Part_Number: MAX20078ATE/V+T; RefDes: RefDes; Type: Type; Supplier 1: Mouser; Supplier Part Number 1: 700-MAX20078ATE/V+T

## Sheet LED_BUK_5.SchDoc
size A; SheetNumber: 6; SheetTotal: 7
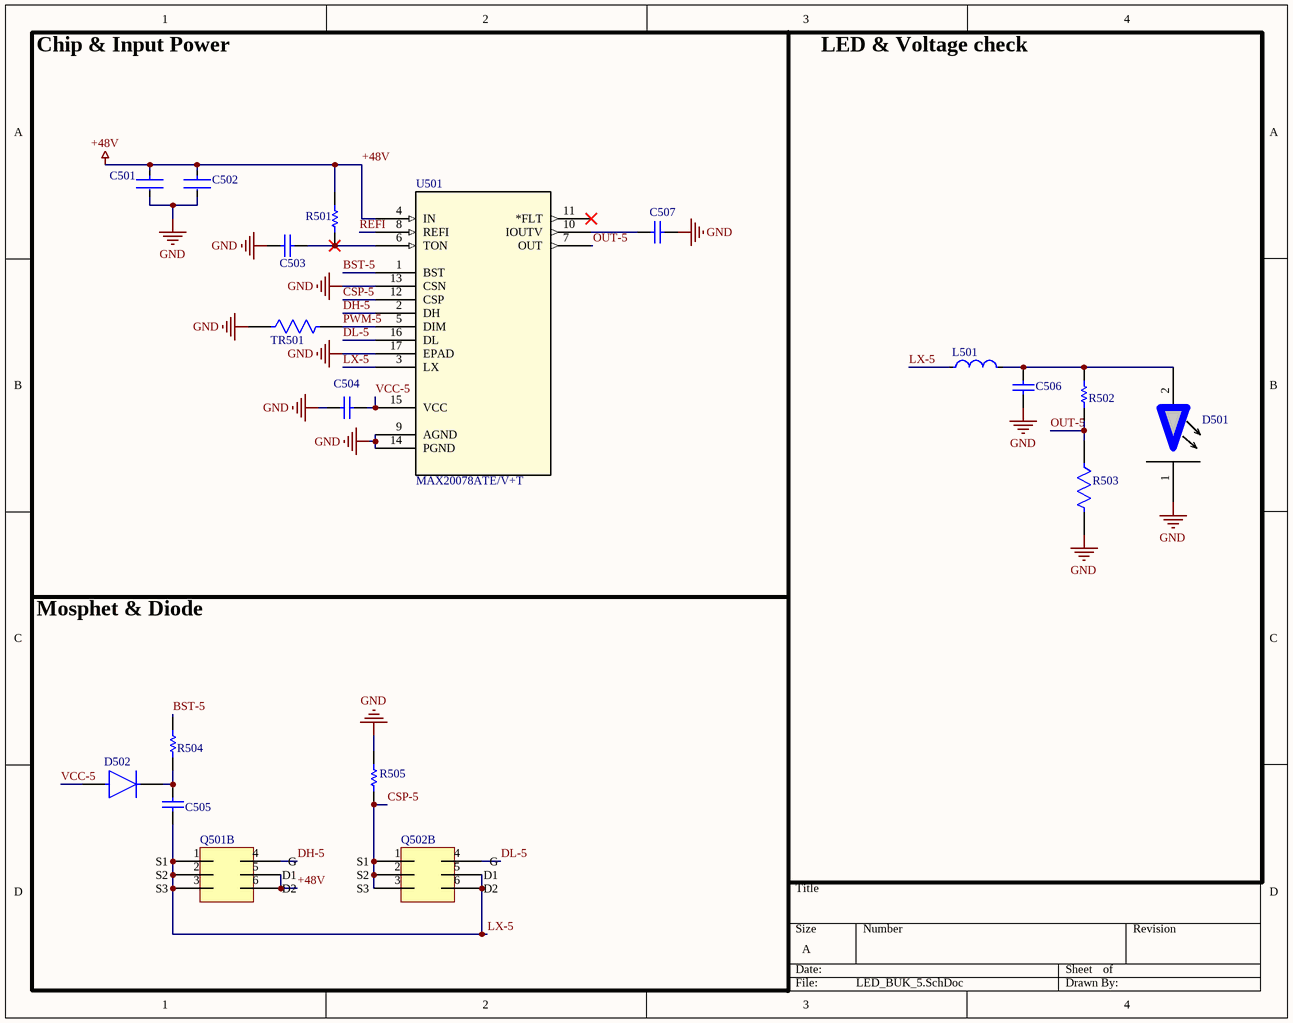
[diagram p5: LED_BUK_5.SchDoc]

### Parts
C501  12101C225KAT2A  [FP-1210-L_3_3_0_4-W_2_5_0-IPC_B]  (value not drawn)
C502  12101C225KAT2A  [FP-1210-L_3_3_0_4-W_2_5_0-IPC_B]  (value not drawn)
C503  GRM1885C1H471JA01D  [C_0603_1608Metric]  (value not drawn)
C504  *AC0805KFX7R7BB225  [C_0805_2012Metric]  (value not drawn)
C505  CL10B224KA8NNNC  [C_0603_1608Metric]  (value not drawn)
C506  CL31B105KCHVPNE  [C_1210_3225Metric]  (value not drawn)
C507  CL31B105KCHVPNE  [C_1210_3225Metric]  (value not drawn)
D501  On back of PCB  [Bridgelux_V22_Custom]  (value not drawn)
D502  B180-13-F  [D_SMA_DO-214AC]  (value not drawn)
L501  YSPI1365-470M  [L_YSPI1365_470M]  (value not drawn)
Q501  custom mosfet  [LFPAK56_SOT669_BUK9Y107]  (value not drawn)  (part B of 2)
Q502  custom mosfet  [LFPAK56_SOT669_BUK9Y107]  (value not drawn)  (part B of 2)
R501  *RC0603FR-0747K5L  [R_0603_1608Metric]  (value not drawn)
R502  RC0603FR-07324KL  [RESC1608X55X25NL10T15]  (value not drawn)
R503  RC0603FR-0724K9L  [FP-RC_L0603-MFG]  (value not drawn)
R504  4R7 1% 0603(1608)  [RESC0603(1608)_M]  (value not drawn)
R505  FRM121WFR100TM  [R_1206_3216Metric]  (value not drawn)
TR501  RC0603FR-0710KL  [FP-RC0603-0_55-IPC_C]  (value not drawn)
U501  MAX20078ATE/V+T  [21-0136V_T1633+4C_MXM]

### Nets
+48V: C501.1 C502.1 Q501.5(D1) Q501.6(D2) R501.1 U501.4(IN)
GND: C501.2 C502.2 C503.1 C504.2 C506.2 C507.2 D501.1 R503.2 R505.1 TR501.1 U501.9(AGND) U501.13(CSN) U501.14(PGND) U501.17(EPAD)
BST-5: R504.2 U501.1(BST)
CSP-5: Q502.1(S1) Q502.2(S2) Q502.3(S3) R505.2 U501.12(CSP)
DH-5: Q501.4(G) U501.2(DH)
DL-5: Q502.4(G) U501.16(DL)
LX-5: C505.2 L501.1 Q501.1(S1) Q501.2(S2) Q501.3(S3) Q502.5(D1) Q502.6(D2) U501.3(LX)
OUT-5: R502.2 R503.1 U501.7(OUT)
PWM-5: TR501.2 U501.5(DIM)
REFI: U501.8(REFI)
VCC-5: C504.1 D502.2(A) U501.15(VCC)
NetC503_2: C503.2 R501.2 U501.6(TON)
NetC505_1: C505.1 D502.1(C) R504.1
NetC506_1: C506.1 D501.2 L501.2 R502.1
NetC507_1: C507.1 U501.10(IOUTV)

Not connected (* = marked no-connect by the designer): U501 11(*FLT)*

### Notes on the sheet
- Chip & Input Power
- LED & Voltage check
- Mosphet & Diode

### Library data of the parts
C501 C502 = CMP-1038-02104-3: as C101 on sheet LED_BUK_1; Number of Pins: 2; Lead Free: Lead Free; Voltage Rating: 100V; Min Operating Temperature: -55°C; Height: 2.79mm; Length: 3.2mm; Capacitance: 2.2uF; RoHS Compliant: Yes; Case/Package: 1210; Max Operating Temperature: 125°C; Radiation Hardening: No; Series: -; Case Code (Metric): 3225; Dielectric: X7R; Voltage Rating (DC): 100V; Packaging: Tape and Reel; Width: 2.5mm; Thickness: 0.11inch; Depth: 2.5mm; Contact Plating: Tin; REACH SVHC: No SVHC; Tolerance: 10%; Construction: Flat; Case Code (Imperial): 1210; Mount: Surface Mount; Package Quantity: 1; Termination: SMD/SMT; Voltage: 100V; LCSC Part #: C2168116
C503 = GRM1885C1H471JA01D: 470 pF, 50 V, C0G, 0603; LCSC Part #: C85979; Supplier 1: Avnet; Supplier Part Number 1: GRM1885C1H471JA01D
C504 = AC0805KFX7R7BB225: 2.2 µF, 16 V, X7R, 0805; Supplier 1: Avnet; Supplier Part Number 1: AC0805KFX7R7BB225; LCSC Part #: C20143097
C505 = CL10B224KA8NNNC: 0.22 µF, 25 V, X7R, 0603; Supplier 1: Future Electronics; Supplier Part Number 1: CL10B224KA8NNNC; LCSC Part #: C21120
C506 C507 = CL31B105KCHVPNE: 1 µF, 100 V DC, 1206 (3216 metric); Supplier 1: Mouser; Supplier Part Number 1: 187-CL31B105KCHVPNE; LCSC Part #: C307368
D501 = Bridgelux_V22_Custom
D502 = B180-13-F: Schottky diode, SMA; Supplier 1: Newark; Supplier Part Number 1: B180-13-F; LCSC Part #: C155354
L501 = CompoYSPI1365-470Mnent_1: 47 µH inductor; LCSC Part #: C497913
Q501 Q502 = BUK9Y107-80EX: as Q101 on sheet LED_BUK_1; Supplier 1: Arrow Electronics; Supplier Part Number 1: BUK9Y107-80EX
R501 = RC0603FR-0747K5L: 47.5 kΩ; Supplier 1: Newark; Supplier Part Number 1: RC0603FR-0747K5L; LCSC Part #: C137715
R502 = CMP-2000-04009-1: Manufacturer: Yageo; Part Number: RC0603FR-07324KL; LCSC Part #: C273758
R503 = CMP-03412-013083-1: as R103 on sheet LED_BUK_1; Footprint Url: https://www.yageo.com/upload/website/yageo_PYu-R_Mount_10_19050818_343.pdf; Automotive: No; Temperature Range Low: -55°C; Manufacturer Part Number: RC0603FR-0724K9L; Ipc Land Pattern Name: RESC16080X45; Digikey Description: RES SMD 24.9K OHM 1% 1/10W 0603; Voltage: 75V; Composition: Thick Film; Device Class L1: Passive Components; Device Class L2: Resistors; Device Class L3: Chip SMD Resistors; ComponentLink2URL: https://www.yageo.com/upload/media/product/productsearch/datasheet/rchip/PYu-RC_Group_51_RoHS_L_10.pdf; Series: RC_L; Octopart: https://octopart.com/rc0603fr-0724k9l-yageo-1189838; RoHS: TRUE; Category: Res; Height: 0.55mm; Tolerance: 1%; Temperature: -55°C to +155°C; Temperature Range High: +155°C; ComponentLink2Description: Datasheet; Package: RC_L0603; Lead Free: Yes; Mouser Description: Res Thick Film 1.6 x 0.8 mm 24.9K Ohm 1% 0.1W(1/10W) 100ppm/ C Molded SMD Paper T/R; LCSC Part #: C137761
R504 = CMP-1012-00247-1: 4R7 0.1W 1% 0603 (1608 Metric)  SMD; LSCS Part #: C137705; Case-EIA: 0603; Case-Metric: 1608; Value: 4.70 Ohm; Power: 0.1 W; Technology: SMT; Tolerance: 1 %
R505 = FRM121WFR100TM: 0.1 Ω, 1 W, 1206; LCSC Part #: C7467250
TR501 = CMP-2100-03664-2: as REFI2 on sheet LED_BUK_1; Depth: 0.8mm; Termination: SMD/SMT; Resistor Type: Thick Film; Series: RC; Construction: Rectangular; Features: Moisture Resistant; Packaging: Tape and Reel; Min Operating Temperature: -55°C; Number of Terminations: 2; Lead Pitch: 0.3mm; RoHS Compliant: Yes; Case/Package: 0603; Resistance Tolerance: 1%; Military Standard: Not; Weight: 7.1E-05oz; Number of Pins: 2; Tolerance: 1%; Length: 1.6mm; Case Code (Imperial): 0603; Lead Free: Lead Free; Width: 0.8mm; Max Power Dissipation: 100mW; Height: 0.45mm; Max Operating Temperature: 155°C; Case Code (Metric): 1608; Size Code: 0603; LCSC Part #: C98220
U501 = MAX20078ATEV+T: as U101 on sheet LED_BUK_1; Copyright: Copyright (C) 2026 Ultra Librarian. All rights reserved.; Manufacturer_Part_Number: MAX20078ATE/V+T; RefDes: RefDes; Type: Type; Supplier 1: Mouser; Supplier Part Number 1: 700-MAX20078ATE/V+T

## Sheet LED_BUK_6.SchDoc
size A; SheetNumber: 7; SheetTotal: 7
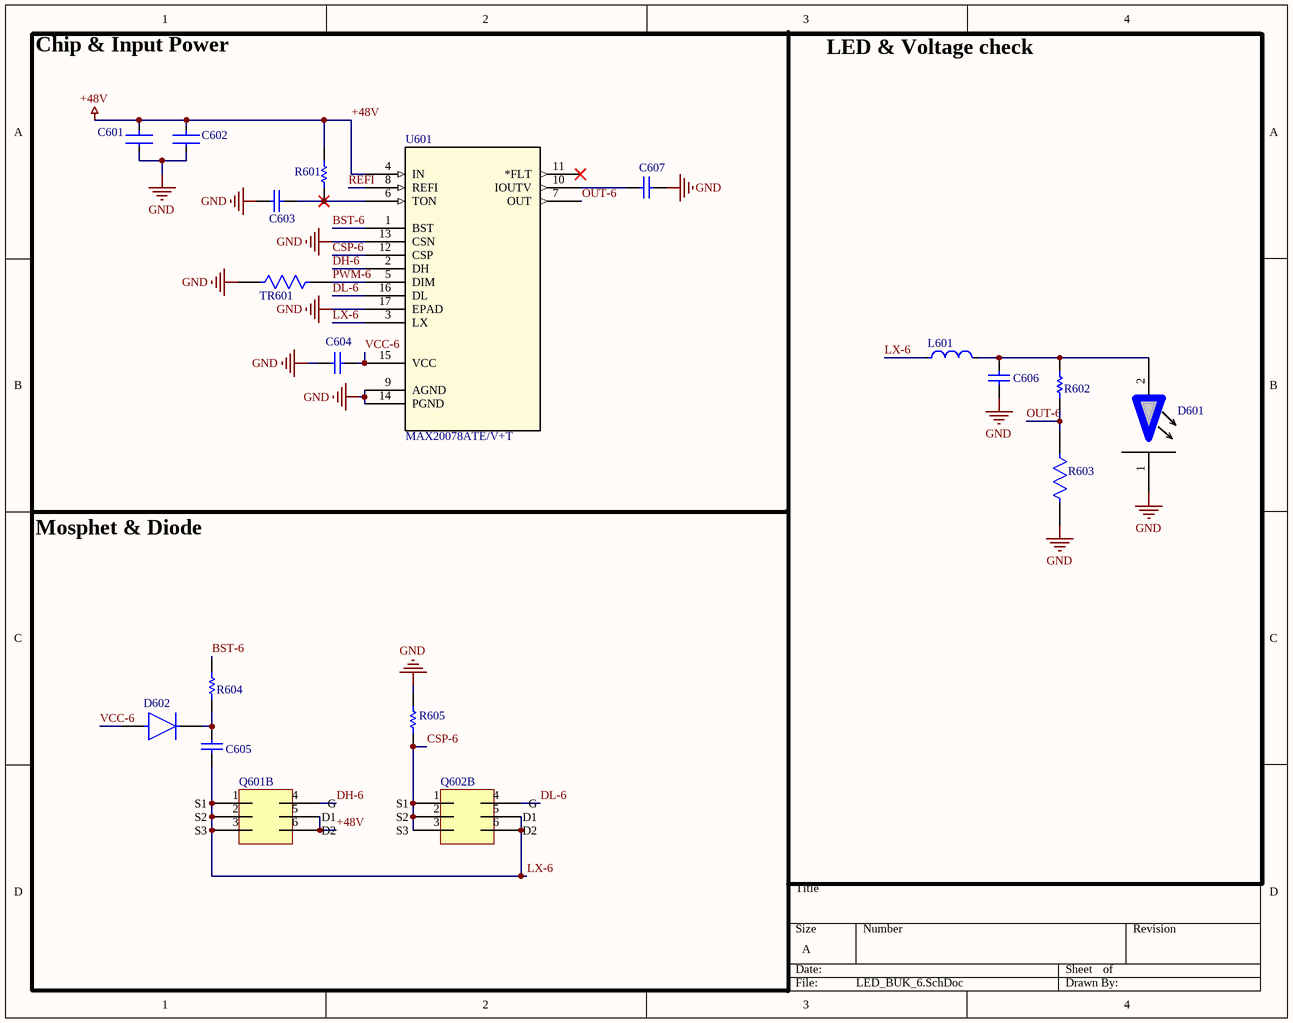
[diagram p6: LED_BUK_6.SchDoc]

### Parts
C601  12101C225KAT2A  [FP-1210-L_3_3_0_4-W_2_5_0-IPC_B]  (value not drawn)
C602  12101C225KAT2A  [FP-1210-L_3_3_0_4-W_2_5_0-IPC_B]  (value not drawn)
C603  GRM1885C1H471JA01D  [C_0603_1608Metric]  (value not drawn)
C604  *AC0805KFX7R7BB225  [C_0805_2012Metric]  (value not drawn)
C605  CL10B224KA8NNNC  [C_0603_1608Metric]  (value not drawn)
C606  CL31B105KCHVPNE  [C_1210_3225Metric]  (value not drawn)
C607  CL31B105KCHVPNE  [C_1210_3225Metric]  (value not drawn)
D601  On back of PCB  [Bridgelux_V22_Custom]  (value not drawn)
D602  B180-13-F  [D_SMA_DO-214AC]  (value not drawn)
L601  YSPI1365-470M  [L_YSPI1365_470M]  (value not drawn)
Q601  custom mosfet  [LFPAK56_SOT669_BUK9Y107]  (value not drawn)  (part B of 2)
Q602  custom mosfet  [LFPAK56_SOT669_BUK9Y107]  (value not drawn)  (part B of 2)
R601  *RC0603FR-0747K5L  [R_0603_1608Metric]  (value not drawn)
R602  RC0603FR-07324KL  [RESC1608X55X25NL10T15]  (value not drawn)
R603  RC0603FR-0724K9L  [FP-RC_L0603-MFG]  (value not drawn)
R604  4R7 1% 0603(1608)  [RESC0603(1608)_M]  (value not drawn)
R605  FRM121WFR100TM  [R_1206_3216Metric]  (value not drawn)
TR601  RC0603FR-0710KL  [FP-RC0603-0_55-IPC_C]  (value not drawn)
U601  MAX20078ATE/V+T  [21-0136V_T1633+4C_MXM]

### Nets
+48V: C601.1 C602.1 Q601.5(D1) Q601.6(D2) R601.1 U601.4(IN)
GND: C601.2 C602.2 C603.1 C604.2 C606.2 C607.2 D601.1 R603.2 R605.1 TR601.1 U601.9(AGND) U601.13(CSN) U601.14(PGND) U601.17(EPAD)
BST-6: R604.2 U601.1(BST)
CSP-6: Q602.1(S1) Q602.2(S2) Q602.3(S3) R605.2 U601.12(CSP)
DH-6: Q601.4(G) U601.2(DH)
DL-6: Q602.4(G) U601.16(DL)
LX-6: C605.2 L601.1 Q601.1(S1) Q601.2(S2) Q601.3(S3) Q602.5(D1) Q602.6(D2) U601.3(LX)
OUT-6: R602.2 R603.1 U601.7(OUT)
PWM-6: TR601.2 U601.5(DIM)
REFI: U601.8(REFI)
VCC-6: C604.1 D602.2(A) U601.15(VCC)
NetC603_2: C603.2 R601.2 U601.6(TON)
NetC605_1: C605.1 D602.1(C) R604.1
NetC606_1: C606.1 D601.2 L601.2 R602.1
NetC607_1: C607.1 U601.10(IOUTV)

Not connected (* = marked no-connect by the designer): U601 11(*FLT)*

### Notes on the sheet
- Chip & Input Power
- LED & Voltage check
- Mosphet & Diode

### Library data of the parts
C601 C602 = CMP-1038-02104-3: as C101 on sheet LED_BUK_1; Number of Pins: 2; Lead Free: Lead Free; Voltage Rating: 100V; Min Operating Temperature: -55°C; Height: 2.79mm; Length: 3.2mm; Capacitance: 2.2uF; RoHS Compliant: Yes; Case/Package: 1210; Max Operating Temperature: 125°C; Radiation Hardening: No; Series: -; Case Code (Metric): 3225; Dielectric: X7R; Voltage Rating (DC): 100V; Packaging: Tape and Reel; Width: 2.5mm; Thickness: 0.11inch; Depth: 2.5mm; Contact Plating: Tin; REACH SVHC: No SVHC; Tolerance: 10%; Construction: Flat; Case Code (Imperial): 1210; Mount: Surface Mount; Package Quantity: 1; Termination: SMD/SMT; Voltage: 100V; LCSC Part #: C2168116
C603 = GRM1885C1H471JA01D: 470 pF, 50 V, C0G, 0603; LCSC Part #: C85979; Supplier 1: Avnet; Supplier Part Number 1: GRM1885C1H471JA01D
C604 = AC0805KFX7R7BB225: 2.2 µF, 16 V, X7R, 0805; Supplier 1: Avnet; Supplier Part Number 1: AC0805KFX7R7BB225; LCSC Part #: C20143097
C605 = CL10B224KA8NNNC: 0.22 µF, 25 V, X7R, 0603; Supplier 1: Future Electronics; Supplier Part Number 1: CL10B224KA8NNNC; LCSC Part #: C21120
C606 C607 = CL31B105KCHVPNE: 1 µF, 100 V DC, 1206 (3216 metric); Supplier 1: Mouser; Supplier Part Number 1: 187-CL31B105KCHVPNE; LCSC Part #: C307368
D601 = Bridgelux_V22_Custom
D602 = B180-13-F: Schottky diode, SMA; Supplier 1: Newark; Supplier Part Number 1: B180-13-F; LCSC Part #: C155354
L601 = CompoYSPI1365-470Mnent_1: 47 µH inductor; LCSC Part #: C497913
Q601 Q602 = BUK9Y107-80EX: as Q101 on sheet LED_BUK_1; Supplier 1: Arrow Electronics; Supplier Part Number 1: BUK9Y107-80EX
R601 = RC0603FR-0747K5L: 47.5 kΩ; Supplier 1: Newark; Supplier Part Number 1: RC0603FR-0747K5L; LCSC Part #: C137715
R602 = CMP-2000-04009-1: Manufacturer: Yageo; Part Number: RC0603FR-07324KL; LCSC Part #: C273758
R603 = CMP-03412-013083-1: as R103 on sheet LED_BUK_1; Footprint Url: https://www.yageo.com/upload/website/yageo_PYu-R_Mount_10_19050818_343.pdf; Automotive: No; Temperature Range Low: -55°C; Manufacturer Part Number: RC0603FR-0724K9L; Ipc Land Pattern Name: RESC16080X45; Digikey Description: RES SMD 24.9K OHM 1% 1/10W 0603; Voltage: 75V; Composition: Thick Film; Device Class L1: Passive Components; Device Class L2: Resistors; Device Class L3: Chip SMD Resistors; ComponentLink2URL: https://www.yageo.com/upload/media/product/productsearch/datasheet/rchip/PYu-RC_Group_51_RoHS_L_10.pdf; Series: RC_L; Octopart: https://octopart.com/rc0603fr-0724k9l-yageo-1189838; RoHS: TRUE; Category: Res; Height: 0.55mm; Tolerance: 1%; Temperature: -55°C to +155°C; Temperature Range High: +155°C; ComponentLink2Description: Datasheet; Package: RC_L0603; Lead Free: Yes; Mouser Description: Res Thick Film 1.6 x 0.8 mm 24.9K Ohm 1% 0.1W(1/10W) 100ppm/ C Molded SMD Paper T/R; LCSC Part #: C137761
R604 = CMP-1012-00247-1: as R504 on sheet LED_BUK_5; Power: 0.1 W; Technology: SMT; Tolerance: 1 %
R605 = FRM121WFR100TM: 0.1 Ω, 1 W, 1206; LCSC Part #: C7467250
TR601 = CMP-2100-03664-2: as REFI2 on sheet LED_BUK_1; Depth: 0.8mm; Termination: SMD/SMT; Resistor Type: Thick Film; Series: RC; Construction: Rectangular; Features: Moisture Resistant; Packaging: Tape and Reel; Min Operating Temperature: -55°C; Number of Terminations: 2; Lead Pitch: 0.3mm; RoHS Compliant: Yes; Case/Package: 0603; Resistance Tolerance: 1%; Military Standard: Not; Weight: 7.1E-05oz; Number of Pins: 2; Tolerance: 1%; Length: 1.6mm; Case Code (Imperial): 0603; Lead Free: Lead Free; Width: 0.8mm; Max Power Dissipation: 100mW; Height: 0.45mm; Max Operating Temperature: 155°C; Case Code (Metric): 1608; Size Code: 0603; LCSC Part #: C98220
U601 = MAX20078ATEV+T: as U101 on sheet LED_BUK_1; Copyright: Copyright (C) 2026 Ultra Librarian. All rights reserved.; Manufacturer_Part_Number: MAX20078ATE/V+T; RefDes: RefDes; Type: Type; Supplier 1: Mouser; Supplier Part Number 1: 700-MAX20078ATE/V+T

## Nets that join several sheets
+48V: LED_BUK_1 (6 pins), Power_Connector (C001.1 F001.2), LED_BUK_2 (6 pins), LED_BUK_3 (6 pins), LED_BUK_4 (6 pins), LED_BUK_5 (6 pins), LED_BUK_6 (6 pins)
GND: LED_BUK_1 (15 pins), Power_Connector (C001.2 J0.2), LED_BUK_2 (14 pins), LED_BUK_3 (14 pins), LED_BUK_4 (14 pins), LED_BUK_5 (14 pins), LED_BUK_6 (14 pins)
PWM-1: LED_BUK_1 (TR101.2 U101.5), Power_Connector (T001.2)
PWM-2: Power_Connector (T001.4), LED_BUK_2 (TR201.2 U201.5)
PWM-3: Power_Connector (T001.6), LED_BUK_3 (TR301.2 U301.5)
PWM-4: Power_Connector (T001.8), LED_BUK_4 (TR401.2 U401.5)
PWM-5: Power_Connector (T001.10), LED_BUK_5 (TR501.2 U501.5)
PWM-6: Power_Connector (T001.12), LED_BUK_6 (TR601.2 U601.5)
REFI: LED_BUK_1 (REF1.2 REFI2.1 U101.8), LED_BUK_2 (U201.8), LED_BUK_3 (U301.8), LED_BUK_4 (U401.8), LED_BUK_5 (U501.8), LED_BUK_6 (U601.8)